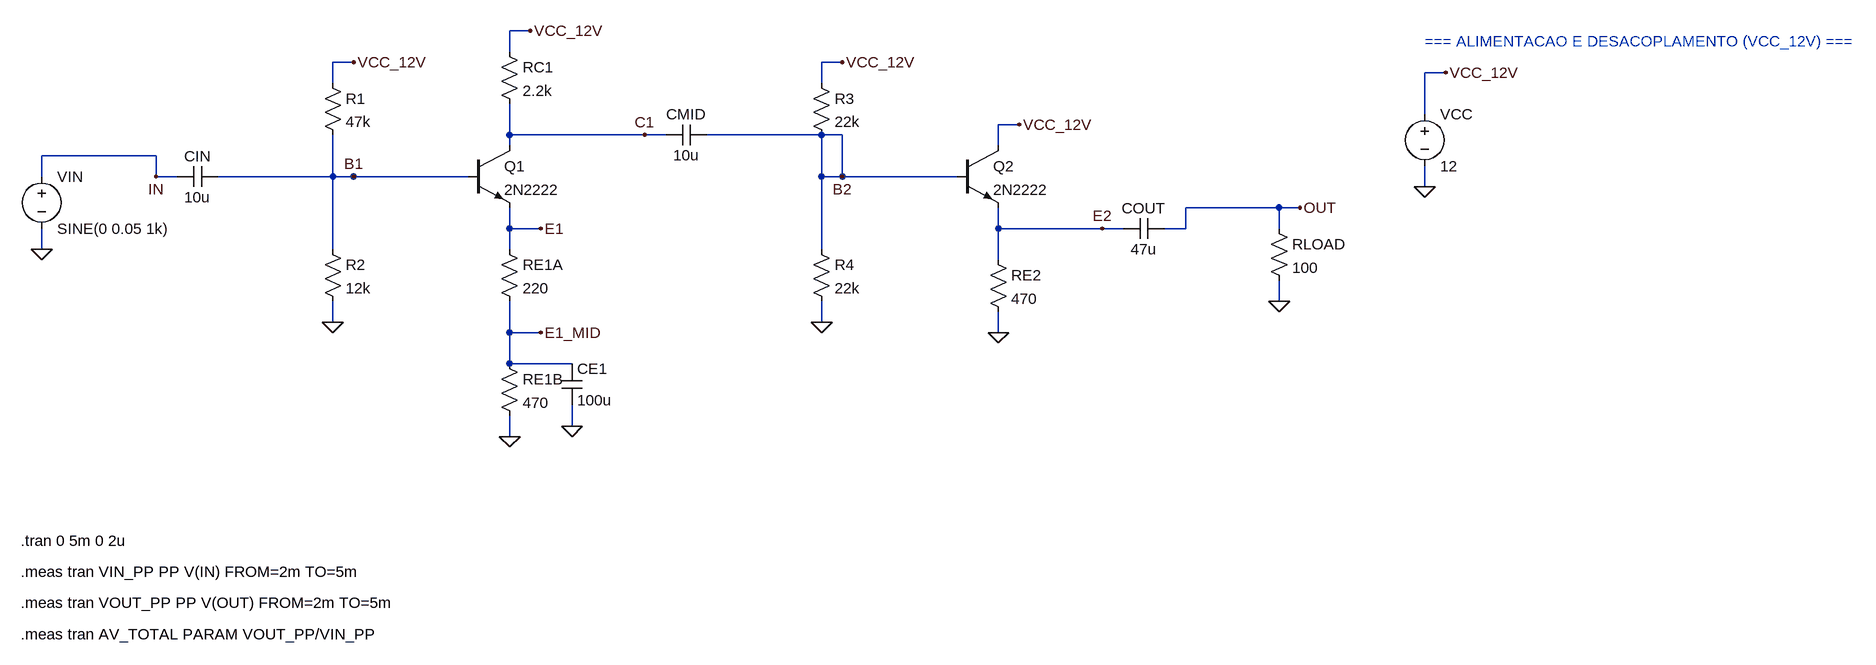
[diagram p0: schematic estilo_A_textbook_wired.asc]
estilo_A_textbook_wired.asc, the LTspice schematic file:
Version 4
SHEET 1 3456 1280
WIRE 96 368 96 400
WIRE 304 288 272 288
WIRE 368 288 400 288
WIRE 544 144 544 112
WIRE 544 112 576 112
WIRE 544 224 544 400
WIRE 544 288 576 288
WIRE 544 480 544 512
WIRE 752 288 720 288
WIRE 816 96 816 64
WIRE 816 64 848 64
WIRE 816 176 816 240
WIRE 816 224 864 224
WIRE 816 336 816 400
WIRE 816 368 864 368
WIRE 816 480 816 576
WIRE 816 528 864 528
WIRE 816 656 816 688
WIRE 816 576 912 576
WIRE 912 640 912 672
WIRE 1056 224 1024 224
WIRE 1120 224 1152 224
WIRE 1296 144 1296 112
WIRE 1296 112 1328 112
WIRE 1296 224 1296 400
WIRE 1296 288 1328 288
WIRE 1296 480 1296 512
WIRE 1504 288 1472 288
WIRE 1568 240 1568 208
WIRE 1568 208 1600 208
WIRE 1568 336 1568 416
WIRE 1568 368 1616 368
WIRE 1568 496 1568 528
WIRE 1760 368 1728 368
WIRE 1824 368 1856 368
WIRE 2000 368 2000 336
WIRE 2000 336 2032 336
WIRE 2000 448 2000 480
WIRE 2224 192 2224 128
WIRE 2224 272 2224 304
WIRE 2224 128 2256 128
WIRE 96 288 96 256
WIRE 96 256 128 256
WIRE 1616 368 1728 368
WIRE 864 224 1024 224
WIRE 128 256 272 256
WIRE 272 256 272 288
WIRE 1856 368 1856 336
WIRE 1856 336 2032 336
WIRE 400 288 576 288
WIRE 576 288 720 288
WIRE 1152 224 1328 224
WIRE 1328 224 1328 288
WIRE 1328 288 1472 288
FLAG 96 400 0
FLAG 272 288 IN
FLAG 576 112 VCC_12V
FLAG 576 288 B1
FLAG 544 512 0
FLAG 848 64 VCC_12V
FLAG 864 368 E1
FLAG 864 528 E1_MID
FLAG 816 688 0
FLAG 912 672 0
FLAG 1024 224 C1
FLAG 1328 112 VCC_12V
FLAG 1328 288 B2
FLAG 1296 512 0
FLAG 1600 208 VCC_12V
FLAG 1568 528 0
FLAG 1728 368 E2
FLAG 2032 336 OUT
FLAG 2000 480 0
FLAG 2224 304 0
FLAG 2256 128 VCC_12V
SYMBOL voltage 96 272 R0
WINDOW 3 24 96 Left 2
SYMATTR InstName VIN
SYMATTR Value SINE(0 0.05 1k)
SYMBOL cap 368 272 R90
WINDOW 0 0 32 VBottom 2
WINDOW 3 32 32 VTop 2
SYMATTR InstName CIN
SYMATTR Value 10u
SYMBOL res 528 128 R0
SYMATTR InstName R1
SYMATTR Value 47k
SYMBOL res 528 384 R0
SYMATTR InstName R2
SYMATTR Value 12k
SYMBOL npn 752 240 R0
SYMATTR InstName Q1
SYMATTR Value 2N2222
SYMBOL res 800 80 R0
SYMATTR InstName RC1
SYMATTR Value 2.2k
SYMBOL res 800 384 R0
SYMATTR InstName RE1A
SYMATTR Value 220
SYMBOL res 800 560 R0
SYMATTR InstName RE1B
SYMATTR Value 470
SYMBOL cap 896 576 R0
SYMATTR InstName CE1
SYMATTR Value 100u
SYMBOL cap 1120 208 R90
WINDOW 0 0 32 VBottom 2
WINDOW 3 32 32 VTop 2
SYMATTR InstName CMID
SYMATTR Value 10u
SYMBOL res 1280 128 R0
SYMATTR InstName R3
SYMATTR Value 22k
SYMBOL res 1280 384 R0
SYMATTR InstName R4
SYMATTR Value 22k
SYMBOL npn 1504 240 R0
SYMATTR InstName Q2
SYMATTR Value 2N2222
SYMBOL res 1552 400 R0
SYMATTR InstName RE2
SYMATTR Value 470
SYMBOL cap 1824 352 R90
WINDOW 0 0 32 VBottom 2
WINDOW 3 32 32 VTop 2
SYMATTR InstName COUT
SYMATTR Value 47u
SYMBOL res 1984 352 R0
SYMATTR InstName RLOAD
SYMATTR Value 100
SYMBOL voltage 2224 176 R0
WINDOW 3 24 96 Left 2
SYMATTR InstName VCC
SYMATTR Value 12
TEXT 2224 80 Left 2 ;=== ALIMENTACAO E DESACOPLAMENTO (VCC_12V) ===
TEXT 64 848 Left 2 !.tran 0 5m 0 2u
TEXT 64 896 Left 2 !.meas tran VIN_PP PP V(IN) FROM=2m TO=5m
TEXT 64 944 Left 2 !.meas tran VOUT_PP PP V(OUT) FROM=2m TO=5m
TEXT 64 992 Left 2 !.meas tran AV_TOTAL PARAM VOUT_PP/VIN_PP

The netlist it stands for:
* estilo_A_textbook_wired.asc
VIN IN 0 SINE(0 0.05 1k)
CIN B1 IN 10u
R1 VCC_12V B1 47k
R2 B1 0 12k
Q1 C1 B1 E1 0 2N2222
RC1 VCC_12V C1 2.2k
RE1A E1 E1_MID 220
RE1B E1_MID 0 470
CE1 E1_MID 0 100u
CMID B2 C1 10u
R3 VCC_12V B2 22k
R4 B2 0 22k
Q2 VCC_12V B2 E2 0 2N2222
RE2 E2 0 470
COUT OUT E2 47u
RLOAD OUT 0 100
VCC VCC_12V 0 12
.model NPN NPN
.model PNP PNP
.lib standard.bjt
* === ALIMENTACAO E DESACOPLAMENTO (VCC_12V) ===
.tran 0 5m 0 2u
.meas tran VIN_PP PP V(IN) FROM=2m TO=5m
.meas tran VOUT_PP PP V(OUT) FROM=2m TO=5m
.meas tran AV_TOTAL PARAM VOUT_PP/VIN_PP
.backanno
.end